# Altium schematic sheet AFE_SHEET.SchDoc
size A4; SheetNumber: 2; SheetTotal: 4
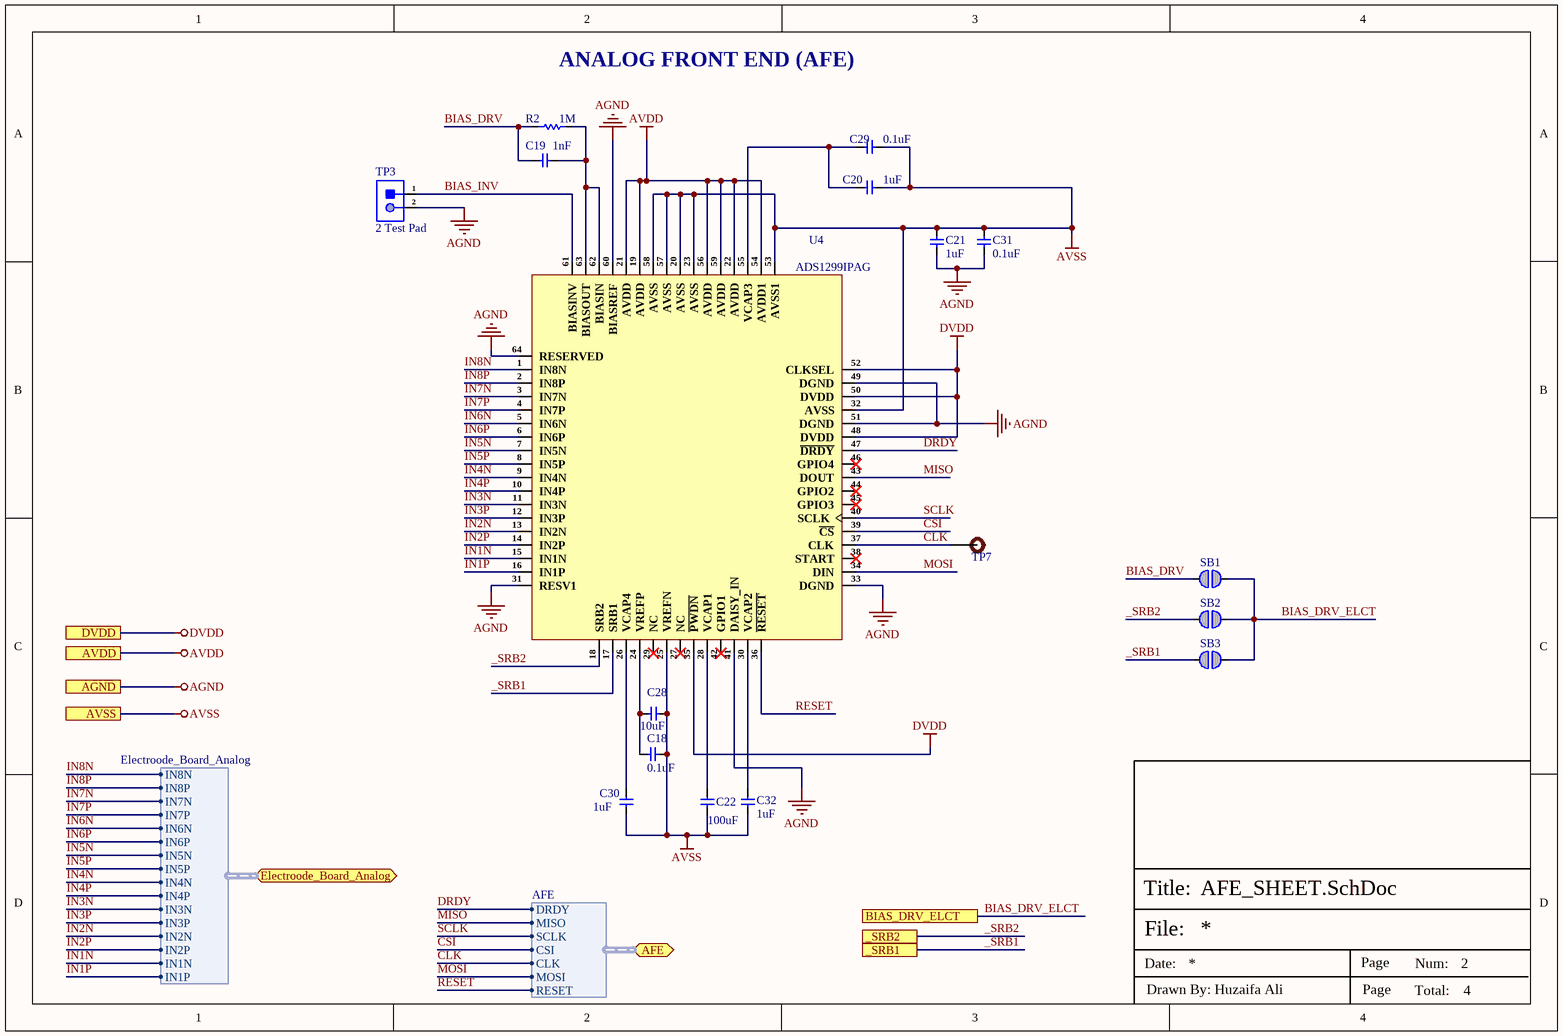
[diagram p0: AFE_SHEET.SchDoc]

## Parts
C18  0.1uF  [Cap-0402]
C19  1nF  [Cap-0402]
C20  1uF  [Cap-0402]
C21  1uF  [Cap-0402]
C22  100uF  [Cap-0805]
C28  10uF  [Cap-0402]
C29  0.1uF  [Cap-0402]
C30  1uF  [Cap-0402]
C31  0.1uF  [Cap-0402]
C32  1uF  [Cap-0402]
R2  1M  [Res-0402]
SB1  Solder Bridge 0603  [Solder Bridge]  (value not drawn)  (no BOM)
SB2  Solder Bridge 0603  [Solder Bridge]  (value not drawn)  (no BOM)
SB3  Solder Bridge 0603  [Solder Bridge]  (value not drawn)  (no BOM)
TP3  2 Test Pad  [2 Test Pad]  (no BOM)
TP7  TEST POINT 0.5mm Dia  [Test-point - 0.5mm]  (value not drawn)  (no BOM)
U4  ADS1299IPAG  [64-TQFP (10x10)]

## Ports
_SRB1, _SRB2, AFE (bidir, harness AFE), AGND, AVDD, AVSS, BIAS_DRV_ELCT, DVDD, Electroode_Board_Analog (bidir, harness Electroode_Board_Analog)

## Harnesses
Electroode_Board_Analog: IN8N, IN8P, IN7N, IN7P, IN6N, IN6P, IN5N, IN5P, IN4N, IN4P, IN3N, IN3P, IN2N, IN2P, IN1N, IN1P
AFE: MISO, DRDY, SCLK, CSI, CLK, MOSI, RESET

## Nets
AGND: C21.1 C31.1 TP3.2 U4.31(RESV1) U4.33(DGND) U4.41(DAISY_IN) U4.49(DGND) U4.51(DGND) U4.60(BIASREF) U4.64(RESERVED) ; port AGND
AVDD: U4.19(AVDD) U4.21(AVDD) U4.22(AVDD) U4.54(AVDD1) U4.56(AVDD) U4.59(AVDD) ; port AVDD
AVSS: C18.2 C20.1 C21.2 C22.1 C28.1 C29.1 C30.1 C31.2 C32.1 U4.20(AVSS) U4.23(AVSS) U4.25(VREFN) U4.32(AVSS) U4.53(AVSS1) U4.57(AVSS) U4.58(AVSS) ; port AVSS
DVDD: U4.35(~{PWDN}) U4.48(DVDD) U4.50(DVDD) U4.52(CLKSEL) ; port DVDD
_SRB1: SB3.2 U4.17(SRB1) ; port _SRB1
_SRB2: SB2.2 U4.18(SRB2) ; port _SRB2
BIAS_DRV: C19.1 R2.1 SB1.2
BIAS_DRV_ELCT: SB1.1 SB2.1 SB3.1 ; port BIAS_DRV_ELCT
BIAS_INV: TP3.1 U4.61(BIASINV)
CLK: TP7.1 U4.37(CLK) ; port AFE.CLK
CSI: U4.39(~{CS}) ; port AFE.CSI
DRDY: U4.47(~{DRDY}) ; port AFE.DRDY
IN1N: U4.15(IN1N) ; port Electroode_Board_Analog.IN1N
IN1P: U4.16(IN1P) ; port Electroode_Board_Analog.IN1P
IN2N: U4.13(IN2N) ; port Electroode_Board_Analog.IN2N
IN2P: U4.14(IN2P) ; port Electroode_Board_Analog.IN2P
IN3N: U4.11(IN3N) ; port Electroode_Board_Analog.IN3N
IN3P: U4.12(IN3P) ; port Electroode_Board_Analog.IN3P
IN4N: U4.9(IN4N) ; port Electroode_Board_Analog.IN4N
IN4P: U4.10(IN4P) ; port Electroode_Board_Analog.IN4P
IN5N: U4.7(IN5N) ; port Electroode_Board_Analog.IN5N
IN5P: U4.8(IN5P) ; port Electroode_Board_Analog.IN5P
IN6N: U4.5(IN6N) ; port Electroode_Board_Analog.IN6N
IN6P: U4.6(IN6P) ; port Electroode_Board_Analog.IN6P
IN7N: U4.3(IN7N) ; port Electroode_Board_Analog.IN7N
IN7P: U4.4(IN7P) ; port Electroode_Board_Analog.IN7P
IN8N: U4.1(IN8N) ; port Electroode_Board_Analog.IN8N
IN8P: U4.2(IN8P) ; port Electroode_Board_Analog.IN8P
MISO: U4.43(DOUT) ; port AFE.MISO
MOSI: U4.34(DIN) ; port AFE.MOSI
RESET: U4.36(~{RESET}) ; port AFE.RESET
SCLK: U4.40(SCLK) ; port AFE.SCLK
NetC18_1: C18.1 C28.2 U4.24(VREFP)
NetC19_2: C19.2 R2.2 U4.62(BIASIN) U4.63(BIASOUT)
NetC20_2: C20.2 C29.2 U4.55(VCAP3)
NetC22_2: C22.2 U4.28(VCAP1)
NetC30_2: C30.2 U4.26(VCAP4)
NetC32_2: C32.2 U4.30(VCAP2)

Not connected (* = marked no-connect by the designer): U4 27(NC)* 29(NC)* 38(START)* 42(GPIO1)* 44(GPIO2)* 45(GPIO3)* 46(GPIO4)*

## Notes on the sheet
- ANALOG FRONT END (AFE)
- File:
- Title:
- Date:
- Page
- Num:
- Total:
- Drawn By: Huzaifa Ali

## Library data of the parts
C18 C29 C31 = CC0402KRX7R7BB104: CAP CER 0.1UF 16V X7R 0402; Manufacturer: Yageo; Item Type: Capacitors; Material: 4241ConductorMaterial; Tolerance: 10%; Value: 100nF; Temperature Coefficient: 30ppm/°C; Supplier: Future Electronics; LCSC Part Number: C60474; Manufacturer Part Number: CC0402KRX7R7BB104; RoHS: Yes; Stock: 22130000; Pricing: 10000=0.0021, 40000=0.002, 150000=0.0019, 250000=0.0019, 500000=0.0018 (USD); Mounting Technology: Surface Mount; Case/Package: 0402; Pins: 2; Case Code (Metric): 1005; Case Code (Imperial): 0402; Min Operating Temperature: -55°C; Max Operating Temperature: 125°C; Dielectric: X7R; Voltage Rating: 16V; Voltage Rating (DC): 16V; Packaging: Tape and Reel; Package Quantity: 1; Termination: SMD/SMT; Voltage: 16V; Series: CC; Voltage Rating (AC): 16V; Length: 1mm; Width: 0.02inch; Height: 0.5mm; Thickness: 0.022inch; Depth: 0.5mm; Radiation Hardening: No; RoHS Compliant: Yes; Reach SVHC Compliant: No; Halogen Free: 5694HalogenFree; Lead Free: 5697LeadFree; ComponentLink1URL: https://datasheet.ciiva.com/11788/0900766b80ce67ed-11788364.pdf?src-supplier=Rs; ComponentLink1Description: https://datasheet.ciiva.com/11788/0900766b80ce67ed-11788364.pdf?src-supplier=Rs; ComponentLink2URL: https://datasheet.ciiva.com/7978/1489800-7978111.pdf?src-supplier=Element14; ComponentLink2Description: https://datasheet.ciiva.com/7978/1489800-7978111.pdf?src-supplier=Element14; ComponentLink3URL: https://datasheet.ciiva.com/161/mlccorderingcode-161545.pdf?src-supplier=Digikey; ComponentLink3Description: https://datasheet.ciiva.com/161/mlccorderingcode-161545.pdf?src-supplier=Digikey; ComponentLink4URL: https://datasheet.ciiva.com/161/mlccorderingcode-161544.pdf?src-supplier=Digikey; ComponentLink4Description: https://datasheet.ciiva.com/161/mlccorderingcode-161544.pdf?src-supplier=Digikey; ComponentLink5URL: https://datasheet.ciiva.com/161/mlccorderingcode-161546.pdf?src-supplier=Digikey; ComponentLink5Description: https://datasheet.ciiva.com/161/mlccorderingcode-161546.pdf?src-supplier=Digikey; ComponentLink6URL: https://datasheet.ciiva.com/8033/1734573-8033661.pdf?src-supplier=Element14; ComponentLink6Description: https://datasheet.ciiva.com/8033/1734573-8033661.pdf?src-supplier=Element14; ComponentLink7URL: https://datasheet.ciiva.com/28450/1489800-28450335.pdf?src-supplier=Element14; ComponentLink7Description: https://datasheet.ciiva.com/28450/1489800-28450335.pdf?src-supplier=Element14; ComponentLink8URL: https://datasheet.ciiva.com/13395/upy-gphc-x7r-6-3v-to-50v-8-13395676.pdf?src-supplier=Mouser; ComponentLink8Description: https://datasheet.ciiva.com/13395/upy-gphc-x7r-6-3v-to-50v-8-13395676.pdf?src-supplier=Mouser; ComponentLink9URL: https://datasheet.ciiva.com/8033/1734573-8033663.pdf?src-supplier=Element14; ComponentLink9Description: https://datasheet.ciiva.com/8033/1734573-8033663.pdf?src-supplier=Element14; ComponentLink10URL: https://datasheet.ciiva.com/11587/upy-gphc-x7r-6-3v-to-50v-8-11587305.pdf?src-supplier=Avnet; ComponentLink10Description: https://datasheet.ciiva.com/11587/upy-gphc-x7r-6-3v-to-50v-8-11587305.pdf?src-supplier=Avnet
C19 = CC0402KRX7R8BB102: CAP CER 1000PF 25V X7R 0402; Manufacturer: Yageo; Tolerance: 10%; Dissipation Factor: 2.5%; Insulation Resistance: 10GR; Item Type: Capacitor; Supplier 1: Arrow Electronics; Manufacturer Part Number: CC0402KRX7R8BB102; RoHS: Yes; Category: Ceramic Capacitors; Stock 1: 370000; Pricing 1: 1=0.00230, 10000=0.00230, 100001=0.00190 (USD); Mount: Surface Mount; Case/Package: 0402; Number of Pins: 2; Case Code (Imperial): 0402; Case Code (Metric): 1005; Min Operating Temperature: -55°C; Max Operating Temperature: 125°C; Capacitance: 1nF; Packaging: Tape and Reel; Voltage Rating: 25V; Dielectric: X7R; Termination: SMD/SMT; Voltage Rating (DC): 25V; Series: CC; Length: 1mm; Width: 0.02inch; Thickness: 0.022inch; Depth: 0.5mm; Radiation Hardening: No; Lead Free: Lead Free; Halogen Free: Halogen Free; RoHS Compliant: Yes; ComponentLink1URL: https://datasheet.ciiva.com/26862/getdatasheetpartid-639817-26862638.pdf?src-supplier=Verical; ComponentLink1Description: https://datasheet.ciiva.com/26862/getdatasheetpartid-639817-26862638.pdf?src-supplier=Verical; ComponentLink2URL: https://datasheet.ciiva.com/5425/upy-gp-np0-16v-to-50v-8-3714-5425527.pdf?src-supplier=Mouser; ComponentLink2Description: https://datasheet.ciiva.com/5425/upy-gp-np0-16v-to-50v-8-3714-5425527.pdf?src-supplier=Mouser; Supplier Part Number 1: CC0402KRX7R8BB102; LCSC Part Number: C541372
C20 C21 C30 C32 = CC0402KRX5R8BB105: CAP CER 1UF 25V X5R 0402; Manufacturer: Yageo; Tolerance: 10%; Supplier 1: Mouser; Manufacturer Part Number: CC0402KRX5R8BB105; RoHS: Yes; Category: Ceramic Capacitors; Stock 1: 91975; Pricing 1: 1=0.30000, 10=0.20400, 50=0.20400, 100=0.11600, 1000=0.07200, 10000=0.05900 (USD); Mount: Surface Mount; Case/Package: 0402; Case Code (Metric): 1005; Case Code (Imperial): 0402; Weight: 2.3E-05oz; Min Operating Temperature: -55°C; Max Operating Temperature: 85°C; Packaging: Tape and Reel; Capacitance: 1uF; Voltage Rating: 25V; Dielectric: X5R; Termination: SMD/SMT; Voltage Rating (DC): 25V; Package Quantity: 10000; Length: 0.039inch; Width: 0.02inch; Thickness: 0.022inch; Lead Free: Lead Free; Halogen Free: Halogen Free; RoHS Compliant: Yes; ComponentLink1URL: http://www.mouser.com/ds/2/447/Yageo_UPY-GP_NP0_16V-to-50V_9-358835.pdf?src-supplier=Mouser; ComponentLink1Description: http://www.mouser.com/ds/2/447/Yageo_UPY-GP_NP0_16V-to-50V_9-358835.pdf?src-supplier=Mouser; ComponentLink2URL: http://www.yageo.com/documents/recent/UPY-GPHC_X5R_4V-to-50V_25.pdf?src-supplier=Digi-Key; ComponentLink2Description: http://www.yageo.com/documents/recent/UPY-GPHC_X5R_4V-to-50V_25.pdf?src-supplier=Digi-Key; ComponentLink3URL: https://4donline.ihs.com/images/VipMasterIC/IC/YAGO/YAGO-S-A0006851646/YAGO-S-A0006851646-1.pdf?hkey=6D3A4C79FDBF58556ACFDE234799DDF0&src-supplier=Newark; ComponentLink3Description: https://4donline.ihs.com/images/VipMasterIC/IC/YAGO/YAGO-S-A0006851646/YAGO-S-A0006851646-1.pdf?hkey=6D3A4C79FDBF58556ACFDE234799DDF0&src-supplier=Newark; Supplier Part Number 1: 603-CC402KRX5R8BB105; LCSC Part Number: C326568
C22 = GRM21BR60J107ME15L: CAP CER 100UF 6.3V X5R 0805; Manufacturer: Murata; Item Type: Capacitors; Material: 4241ConductorMaterial; Tolerance: 20%; Supplier: Mouser; LCSC Part Number: C141660; Manufacturer Part Number: GRM21BR60J107ME15L; RoHS: Yes; Stock: 94172; Pricing: 1=1.28, 10=0.697, 50=0.697, 100=0.633, 1000=0.485, 10000=0.384 (USD); Lead Free: Lead Free; ComponentLink1URL: http://www.farnell.com/datasheets/1957830.pdf?src-supplier=Farnell; ComponentLink1Description: http://www.farnell.com/datasheets/1957830.pdf?src-supplier=Farnell; Mounting Technology: Surface Mount; Case/Package: 0805; Case Code (Metric): 2012; Case Code (Imperial): 0805; Min Operating Temperature: -55°C; Max Operating Temperature: 85°C; Packaging: Cut Tape; Voltage Rating: 6.3V; Dielectric: X5R; Voltage Rating (DC): 6.3V; Value: 100uF; Series: GRM; Length: 0.079inch; Width: 0.049inch; Height: 1.45mm; Thickness: 0.057inch; Reach SVHC Compliant: No; RoHS Compliant: Yes; ComponentLink2URL: https://datasheet.octopart.com/GRM21BR60J107ME15L-Murata-datasheet-48012791.pdf?src-supplier=Element14; ComponentLink2Description: https://datasheet.octopart.com/GRM21BR60J107ME15L-Murata-datasheet-48012791.pdf?src-supplier=Element14; ComponentLink3URL: http://www.farnell.com/datasheets/1957830.pdf?src-supplier=Element14; ComponentLink3Description: http://www.farnell.com/datasheets/1957830.pdf?src-supplier=Element14; ComponentLink4URL: https://search.murata.co.jp/Ceramy/image/img/A01X/G101/ENG/GRM21BR60J107ME15-01.pdf?src-supplier=Digikey; ComponentLink4Description: https://search.murata.co.jp/Ceramy/image/img/A01X/G101/ENG/GRM21BR60J107ME15-01.pdf?src-supplier=Digikey; ComponentLink5URL: https://datasheet.octopart.com/GRM21BR60J107ME15L-Murata-datasheet-62287462.pdf?src-supplier=Future+Electronics; ComponentLink5Description: https://datasheet.octopart.com/GRM21BR60J107ME15L-Murata-datasheet-62287462.pdf?src-supplier=Future+Electronics; ComponentLink6URL: http://www.farnell.com/datasheets/1957830.pdf?src-supplier=Newark; ComponentLink6Description: http://www.farnell.com/datasheets/1957830.pdf?src-supplier=Newark; ComponentLink7URL: https://datasheet.octopart.com/GRM21BR60J107ME15L-Murata-datasheet-165579666.pdf?src-supplier=TME; ComponentLink7Description: https://datasheet.octopart.com/GRM21BR60J107ME15L-Murata-datasheet-165579666.pdf?src-supplier=TME
C28 = CL05A106MP5NUNC: CAP CER 10UF 10V X5R 0402; Manufacturer: Samsung; Tolerance: 20%; Item Type: Capacitor; Supplier 1: Avnet; Manufacturer Part Number: CL05A106MP5NUNC; RoHS: Yes; Category: Ceramic Capacitors; Stock 1: 1729850; Pricing 1: 10000=0.02537 (USD); Mount: Surface Mount; Case/Package: 0402; Case Code (Metric): 1005; Case Code (Imperial): 0402; Contact Plating: Tin; Min Operating Temperature: -55°C; Max Operating Temperature: 85°C; Package Quantity: 1; Packaging: Tape and Reel; Capacitance: 10uF; Voltage Rating: 10V; Dielectric: X5R; Termination: Wraparound; Series: CL; Construction: Flat; Length: 1mm; Width: 0.02inch; Thickness: 0.028inch; Depth: 0.5mm; Radiation Hardening: No; Lead Free: Lead Free; RoHS Compliant: Yes; ComponentLink1URL: https://datasheet.ciiva.com/25721/cl05a106mp5nunc-25721584.pdf?src-supplier=Digi-Key; ComponentLink1Description: https://datasheet.ciiva.com/25721/cl05a106mp5nunc-25721584.pdf?src-supplier=Digi-Key; ComponentLink2URL: https://datasheet.ciiva.com/26838/getdatasheetpartid-745310-26838170.pdf?src-supplier=Verical; ComponentLink2Description: https://datasheet.ciiva.com/26838/getdatasheetpartid-745310-26838170.pdf?src-supplier=Verical; Supplier Part Number 1: CL05A106MP5NUNC; LCSC Part Number: C315248
R2 = RC0402FR-071ML: RES 1M OHM 1% 1/16W 0402; Manufacturer: Yageo; Value: 1MR; Power Rating: 63mW; Voltage Rating: 50V; Temperature Coefficient: 100ppm/°C; Item Type: Resistor; Supplier: Digikey; Supplier Part Number: 311-1.00MLRCT-ND; Manufacturer Part Number: RC0402FR-071ML; RoHS: Yes; Category: Chip SMD Resistors; Stock: 6516; Pricing: 1=0.1, 10=0.015, 50=0.0088, 100=0.0073, 500=0.00488, 1000=0.00417, 5000=0.00297 (USD); Case/Package: 0402; Case Code (Imperial): 0402; Case Code (Metric): 1005; Min Operating Temperature: -55°C; Max Operating Temperature: 155°C; Resistor Type: Thick Film; Packaging: Tape and Reel; Tolerance: 1%; Termination: SMD/SMT; Features: Moisture Resistant; Series: RC; Max Power Dissipation: 63mW; Number of Terminations: 2; Resistance Tolerance: 1%; Construction: Rectangular; Technology: THICK FILM; Voltage Rating (AC): 50V; Length: 1mm; Height: 0.32mm; Depth: 0.5mm; RoHS Compliant: Yes; Military Standard: Not; Reach SVHC Compliant: Unknown; Lead Free: 5697LeadFree; ComponentLink1URL: https://datasheet.ciiva.com/11808/0900766b80c66297-11808125.pdf?src-supplier=Rs; ComponentLink1Description: https://datasheet.ciiva.com/11808/0900766b80c66297-11808125.pdf?src-supplier=Rs; ComponentLink2URL: https://datasheet.ciiva.com/46394/1018594-46394951.pdf?src-supplier=Element14; ComponentLink2Description: https://datasheet.ciiva.com/46394/1018594-46394951.pdf?src-supplier=Element14; ComponentLink3URL: https://datasheet.ciiva.com/7849/1018594-7849883.pdf?src-supplier=Element14; ComponentLink3Description: https://datasheet.ciiva.com/7849/1018594-7849883.pdf?src-supplier=Element14; ComponentLink4URL: https://datasheet.ciiva.com/7849/1018594-7849882.pdf?src-supplier=Element14; ComponentLink4Description: https://datasheet.ciiva.com/7849/1018594-7849882.pdf?src-supplier=Element14; ComponentLink5URL: https://datasheet.ciiva.com/16741/pyu-rc0402-51-rohs-l-6-r-16741081.pdf?src-supplier=Future+Electronics; ComponentLink5Description: https://datasheet.ciiva.com/16741/pyu-rc0402-51-rohs-l-6-r-16741081.pdf?src-supplier=Future+Electronics; LCSC Part Number: C138033
SB1-SB3 = Solder Bridge 0603: Solder Bridge ON; Manufacturer Part Number: Solder Bridge; Item Type: Solder Bridge
TP3 = 2 Test Pad: Wire Connecting Pad; Item Type: Test Point; Manufacturer Part Number: 2 Test Pad
TP7 = TEST POINT 0.5mm Dia: Test Point ON; Item Type: Test Point; Manufacturer Part Number: TEST POINT 0.5mm Dia
U4 = ADS1299IPAG: IC AFE 8 CHAN 24BIT 64TQFP; Manufacturer: Texas Instruments; Power Consumption: 41mW; Supplier: Mouser; LCSC Part Number: C476817; Manufacturer Part Number: ADS1299IPAG; RoHS: Yes; Item Type: IC; Stock: 1661; Pricing: 1=77.46, 10=64.33, 50=60.74, 100=56.93, 1000=56.93, 10000=56.93 (USD); Length: 10mm; Width: 10mm; Height: 1.2mm; Thickness: 1mm; Lead Free: 5697LeadFree; ComponentLink1URL: https://datasheet.ciiva.com/13063/ads1299-224171-13063283.pdf?src-supplier=Mouser; ComponentLink1Description: https://datasheet.ciiva.com/13063/ads1299-224171-13063283.pdf?src-supplier=Mouser; ComponentLink2URL: https://datasheet.ciiva.com/26913/getdatasheetpartid-563195-26913237.pdf?src-supplier=Verical; ComponentLink2Description: https://datasheet.ciiva.com/26913/getdatasheetpartid-563195-26913237.pdf?src-supplier=Verical; ComponentLink3URL: https://datasheet.ciiva.com/6668/ads1299-6668469.pdf?src-supplier=Digikey; ComponentLink3Description: https://datasheet.ciiva.com/6668/ads1299-6668469.pdf?src-supplier=Digikey